# Altium project AudioMoth 1.1.0.PrjPcb
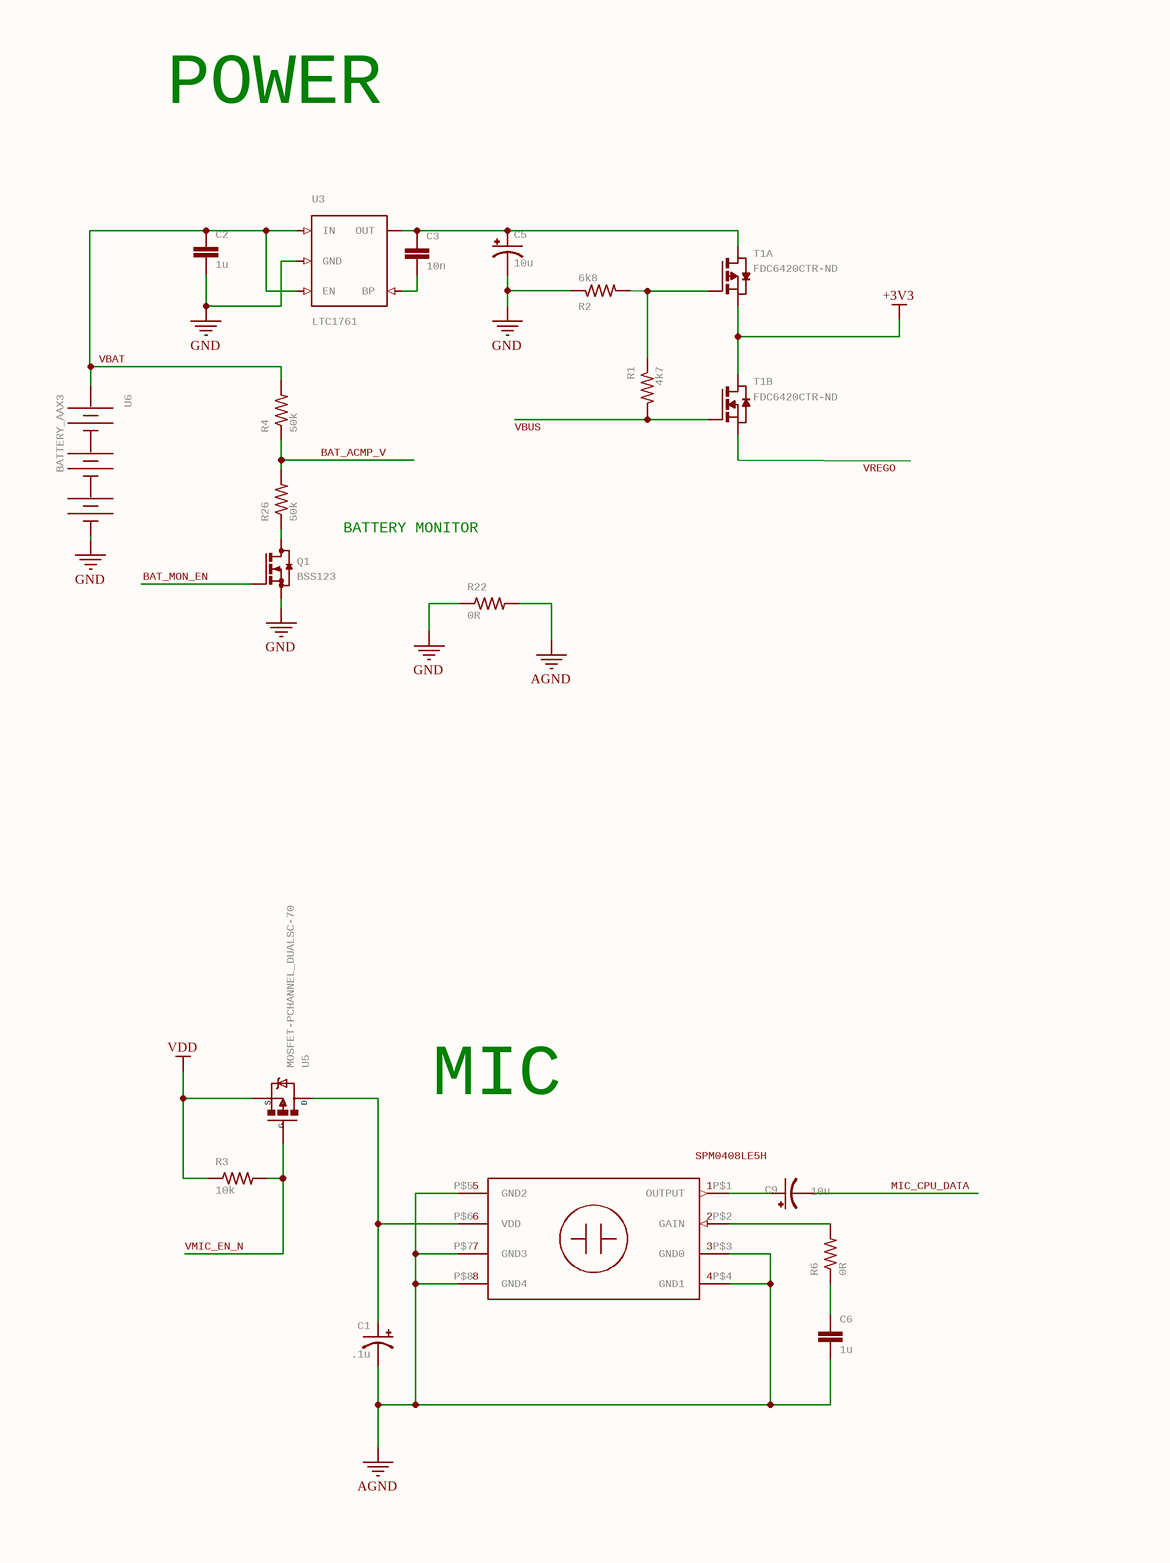
[diagram p0: AudioMoth 1.1.0.SchDoc, top left]
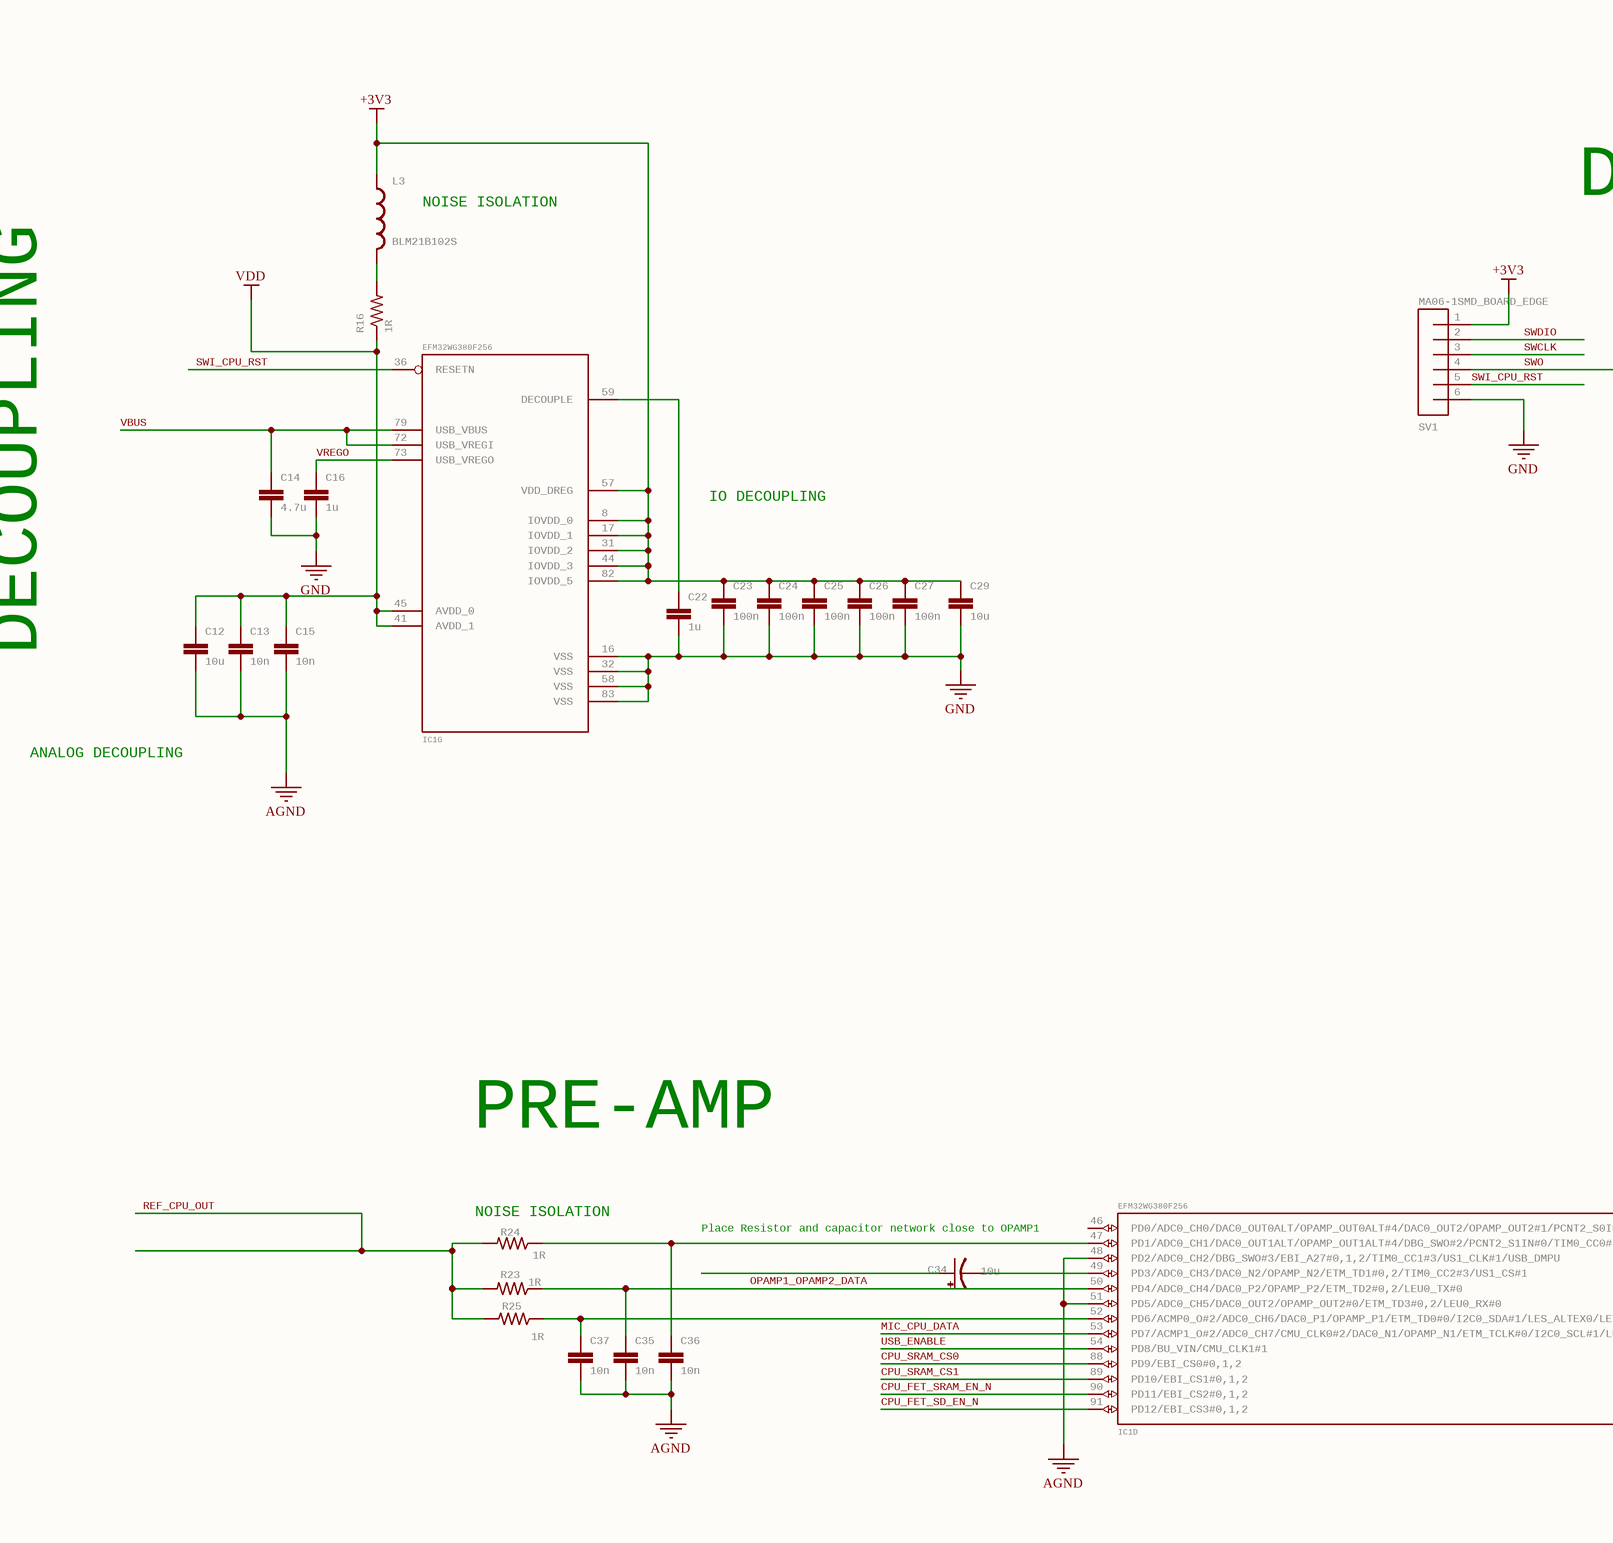
[diagram p1: AudioMoth 1.1.0.SchDoc, top middle]
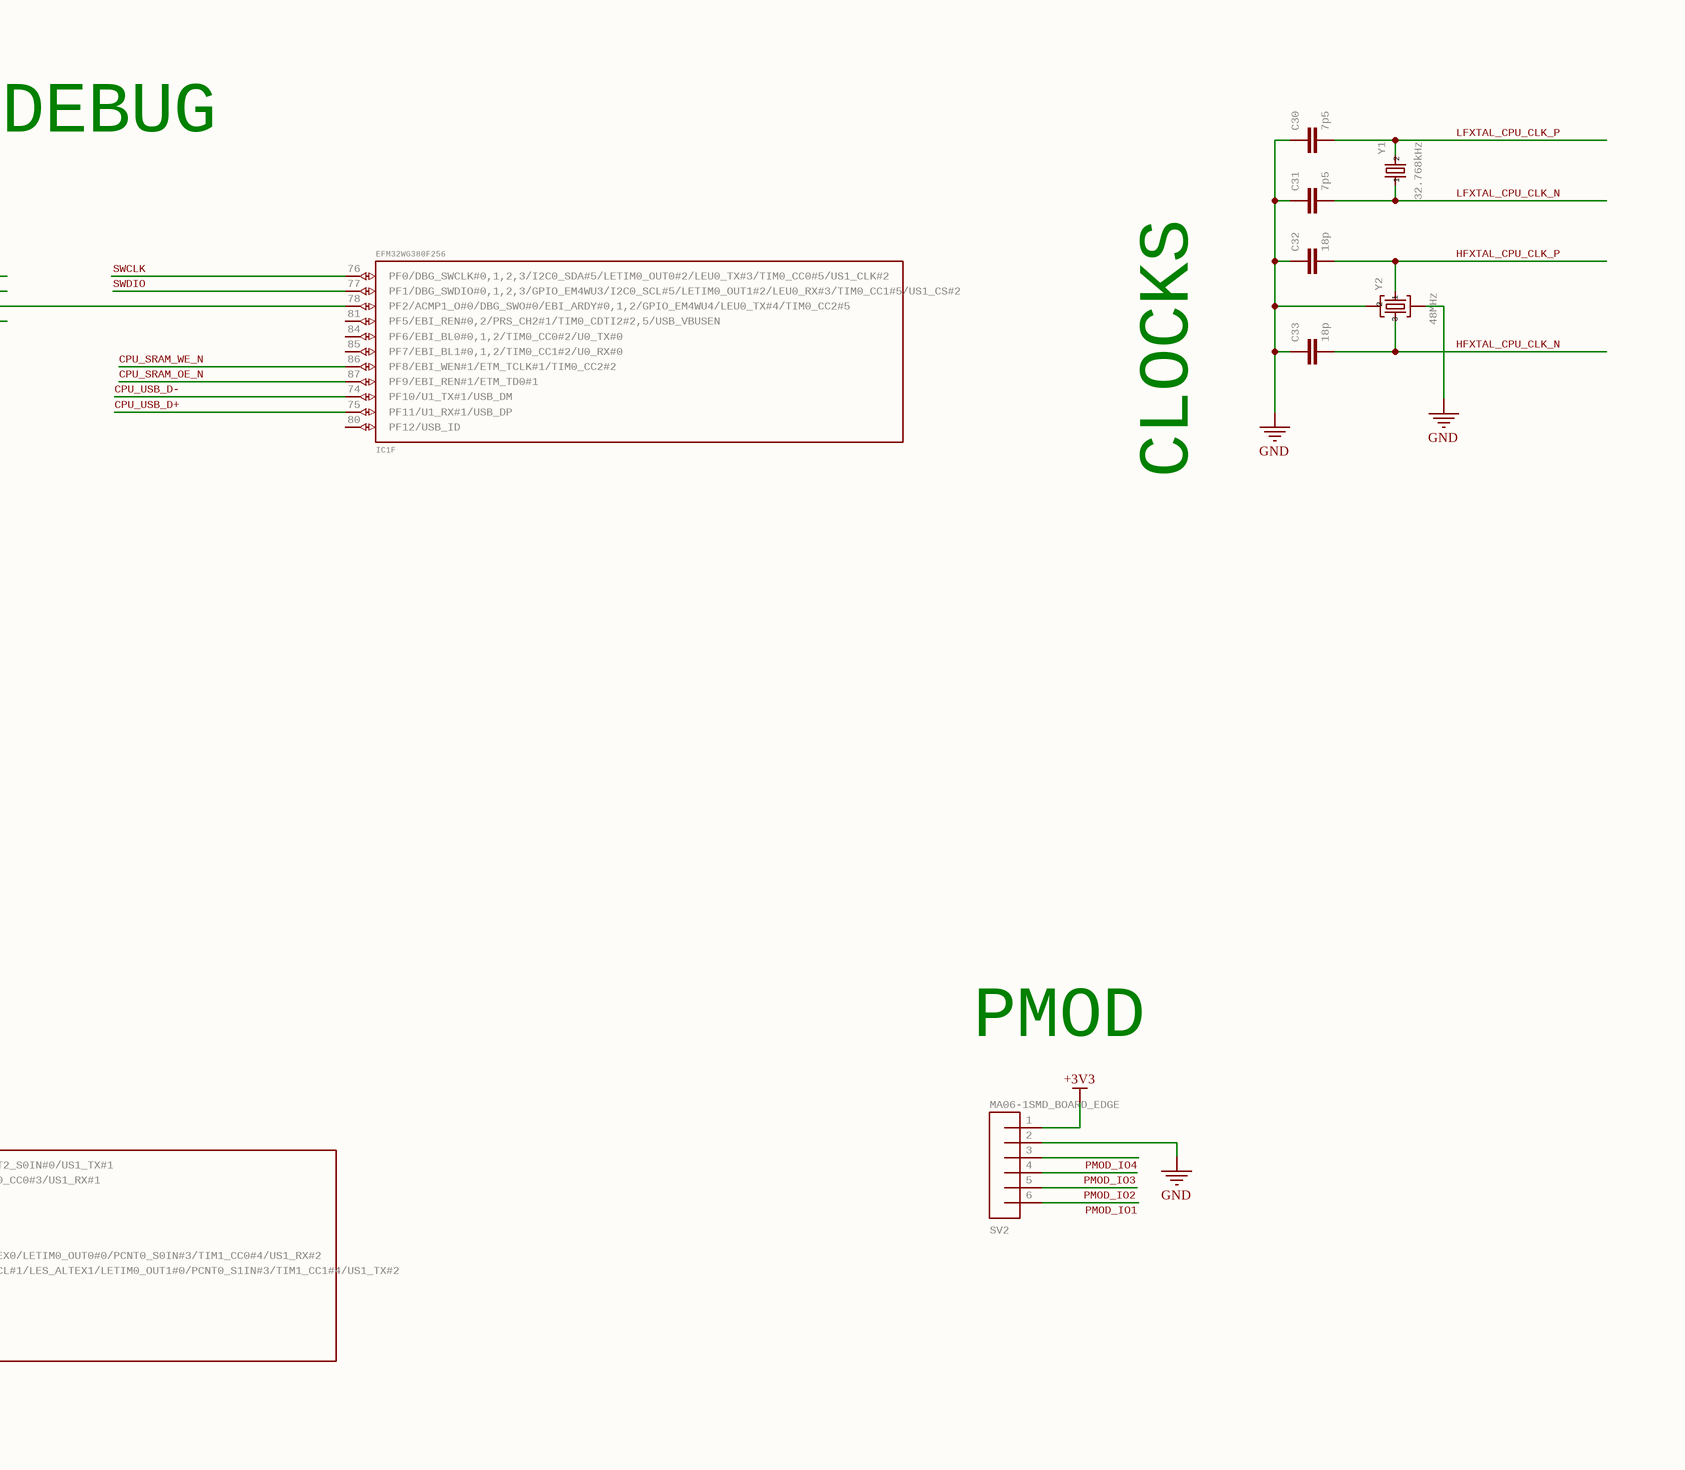
[diagram p2: AudioMoth 1.1.0.SchDoc, top right]
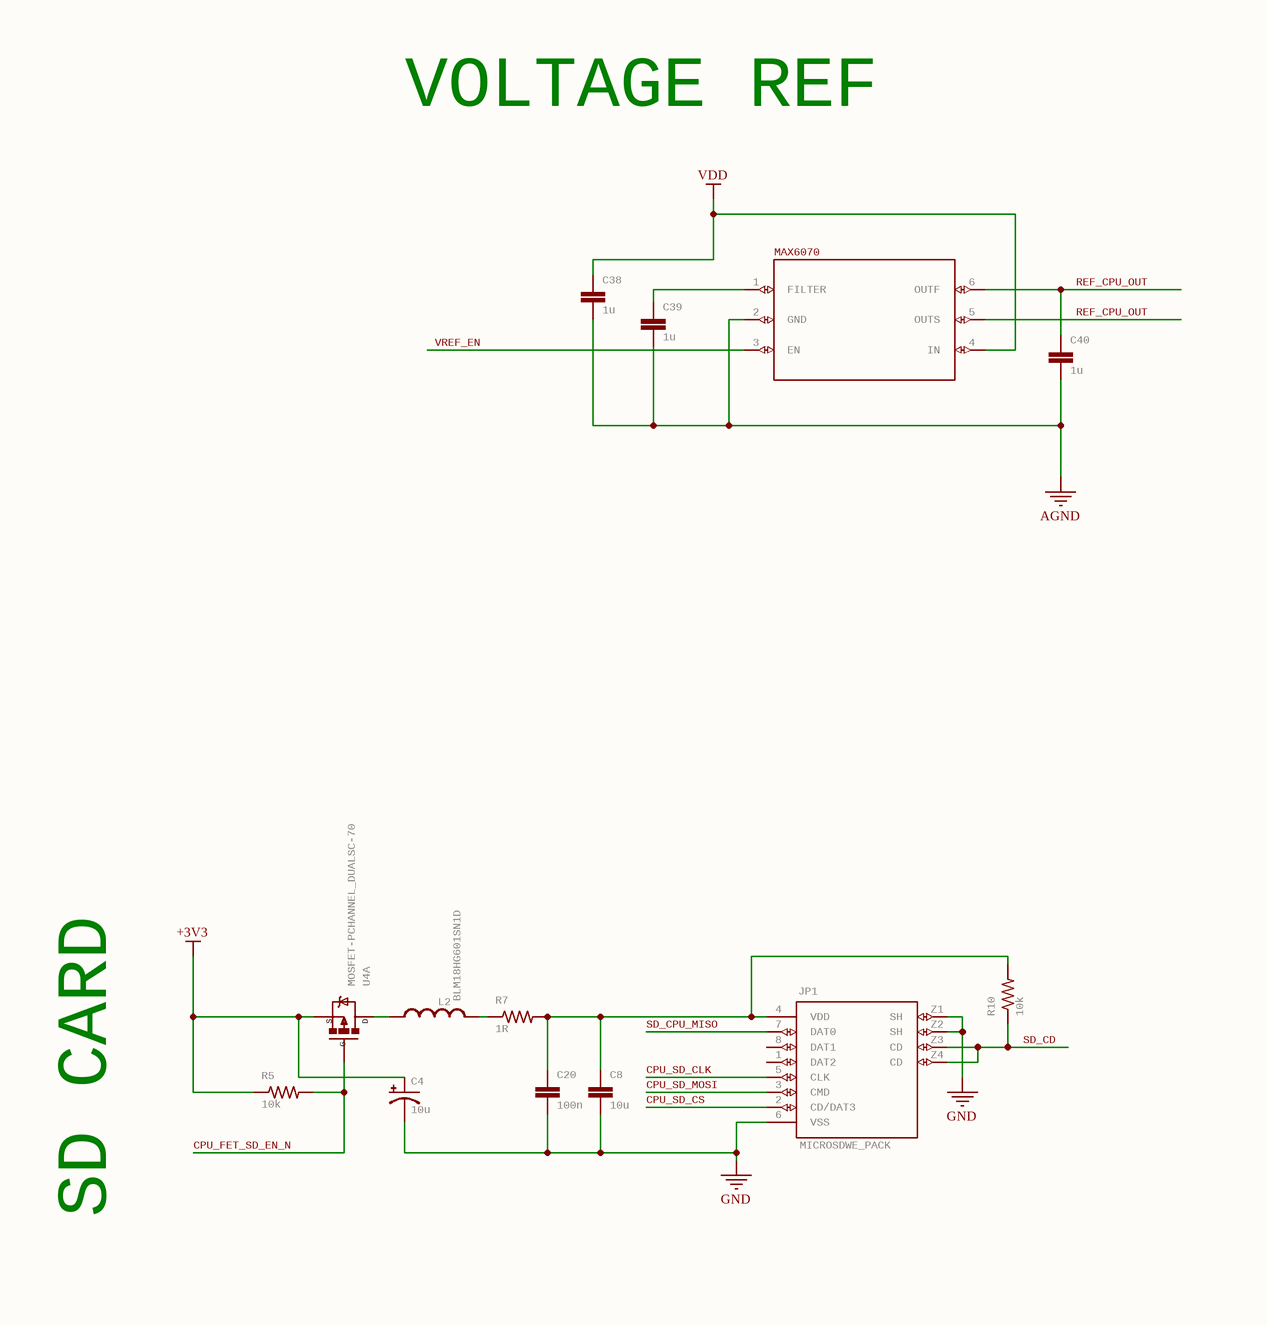
[diagram p3: AudioMoth 1.1.0.SchDoc, bottom left]
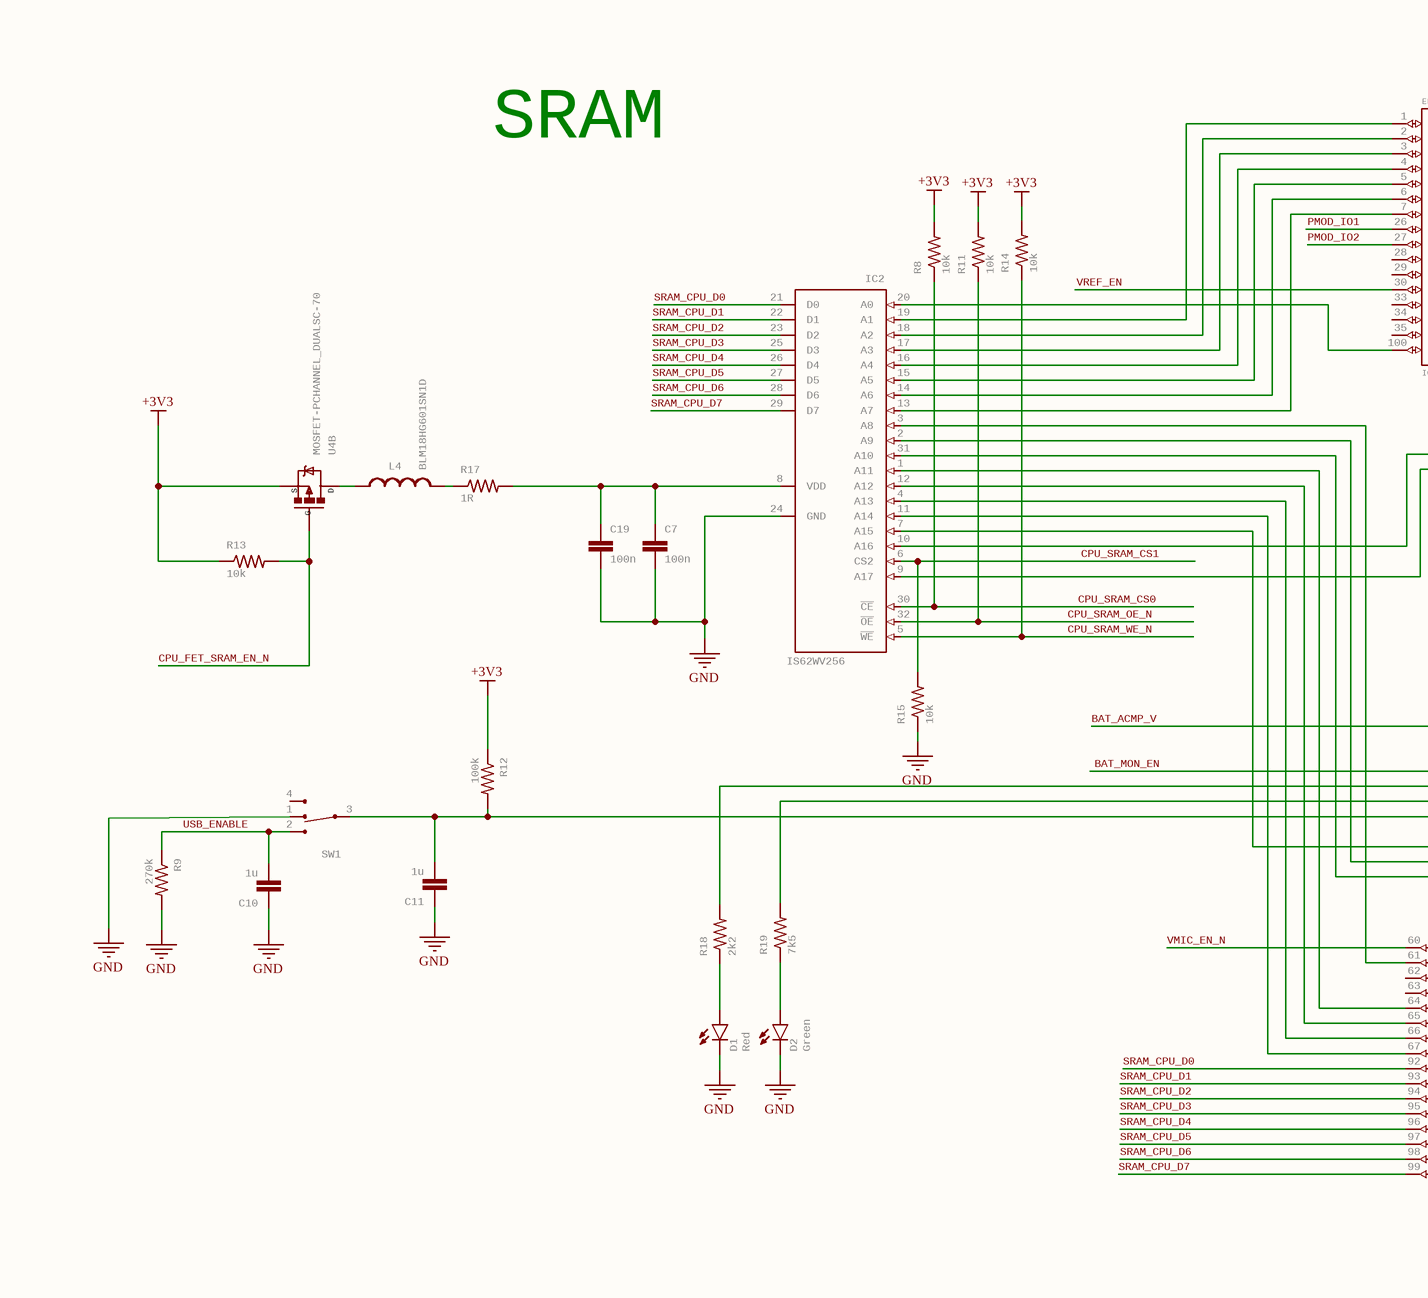
[diagram p4: AudioMoth 1.1.0.SchDoc, bottom middle]
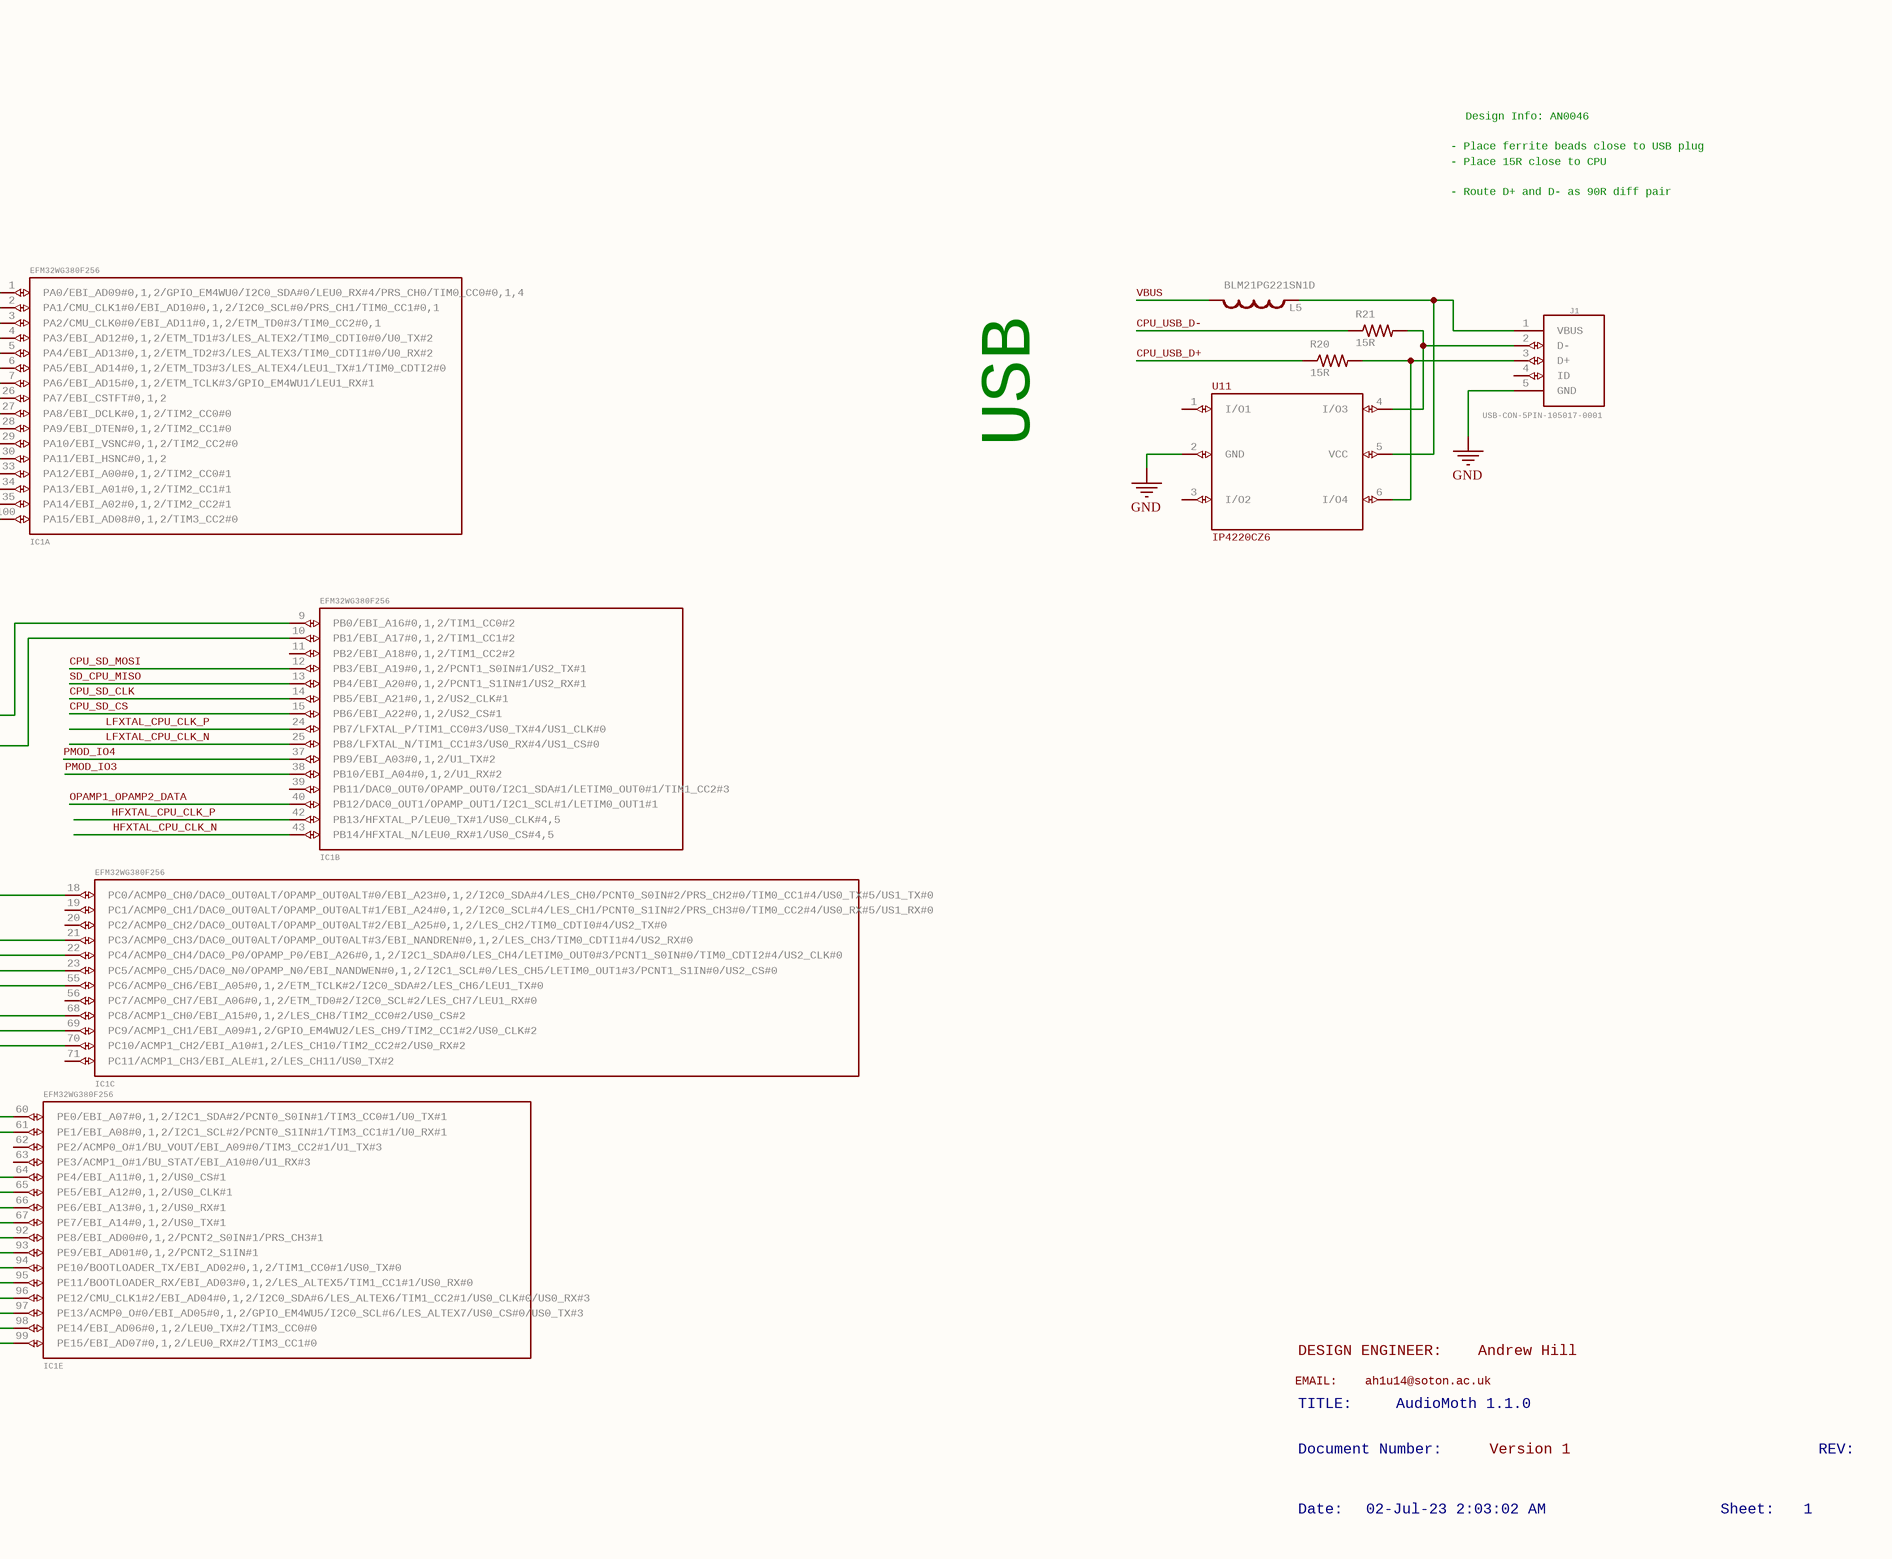
[diagram p5: AudioMoth 1.1.0.SchDoc, bottom right]
1 sheet, 86 parts. Net scope: global (net labels, ports and power ports of the same name join across sheets).
Board file: AudioMoth 1.1.0.PcbDoc

## Sheet AudioMoth 1.1.0.SchDoc: AudioMoth 1.1.0
size 885 x 577 mm; Origin: Eagle; Value: Verion 1; Date: 02-Jul-23 2:03:02 AM; SheetNumber: 1; GateName_1: G$1; SymbolName_1: FRAME_D_L; LibraryName: frames; DeviceSetName: FRAME_D_L; GateName_2: G$2; SymbolName_2: DOCFIELD; Sheet: Sheet:; REV: REV:

### Parts
C1  .1u  [EIA3216-KIT]
C2  1u  [0402]
C3  10n  [0402]
C4  10u  [EIA3216-KIT]
C5  10u  [EIA3216-KIT]
C6  1u  [0402]
C7  100n  [0402]
C8  10u  [C0603]
C9  10u  [EIA3216-KIT]
C10  1u  [0402]
C11  1u  [0402]
C12  10u  [0603-CAP]
C13  10n  [0402]
C14  4.7u  [0402]
C15  10n  [0402]
C16  1u  [0402]
C19  100n  [0402]
C20  100n  [0402]
C22  1u  [0402]
C23  100n  [0402]
C24  100n  [0402]
C25  100n  [0402]
C26  100n  [0402]
C27  100n  [0402]
C29  10u  [C0603]
C30  7p5  [0402]
C31  7p5  [0402]
C32  18p  [0402]
C33  18p  [0402]
C34  10u  [EIA3216-KIT]
C35  10n  [0402]
C36  10n  [0402]
C37  10n  [0402]
C38  1u  [0402]
C39  1u  [0402]
C40  1u  [0402]
D1  Red  [LED-0603]
D2  Green  [LED-0603]
IC1  EFM32WG380F256  [QFP100]  (parts A,B,C,D,E,F,G of 7)
IC2  IS62WV256  [IS62WV256]  (value not drawn)
J1  USB-CON-5PIN-105017-0001  [USB-MICRO-MOLEX-105017-0001]
JP1  MICROSDWE_PACK  [693071010811]
L2  BLM18HG601SN1D  [0603-RES]
L3  BLM21B102S  [0805]
L4  BLM18HG601SN1D  [0603-RES]
L5  BLM21PG221SN1D  [0603-RES]
Q1  BSS123  [SOT23]
R1  4k7  [0402]
R2  6k8  [0402]
R3  10k  [0402]
R4  50k  [0402]
R5  10k  [0402]
R6  0R  [0402]
R7  1R  [0402]
R8  10k  [0402]
R9  270k  [0402]
R10  10k  [0402]
R11  10k  [0402]
R12  100k  [0402]
R13  10k  [0402]
R14  10k  [0402]
R15  10k  [0402]
R16  1R  [0402]
R17  1R  [0402]
R18  2k2  [0402]
R19  7k5  [0402]
R20  15R  [0402]
R21  15R  [0402]
R22  0R  [0603-RES]
R23  1R  [0402]
R24  1R  [0402]
R25  1R  [0402]
R26  50k  [0402]
SV1  MA06-1SMD_BOARD_EDGE  [TSM-106-X-SH-BOARDEDGE]
SV2  MA06-1SMD_BOARD_EDGE  [TSM-106-X-SH-BOARDEDGE]
SW1  CT10-XXXX-CSS131  [CT10-XXXX-G4]  (value not drawn)
T1  FDC6420CTR-ND  [SOT23-6]  (parts A,B of 2)
U1  MAX6070SOT23  [SOT26@1]  (value not drawn)
U2  SPM0408LE5H  [SPM0408LE5H-TB]  (value not drawn)
U3  LTC1761  [SOT23-5]
U4  MOSFET-PCHANNEL_DUALSC-70  [SC-70]  (parts A,B of 2)
U5  MOSFET-PCHANNEL_DUALSC-70  [SC-70]
U6  BATTERY_AAX3  [BATTERY-AAX3]
U11  IP4220CZ6  [SC-74]
Y1  32.768kHz  [CRYSTAL-32KHZ-SMD_EPSON_MC146]
Y2  48MHz  [XRCGB48M000F4M00R0]

### Nets
+3V3: C4.A(+) C23.1 C24.1 C25.1 C26.1 C27.1 C29.1 IC1.8(IOVDD_0) IC1.17(IOVDD_1) IC1.31(IOVDD_2) IC1.44(IOVDD_3) IC1.57(VDD_DREG) IC1.82(IOVDD_5) L3.1 R5.1 R8.2 R11.2 R12.1 R13.1 R14.2 SV1.1 SV2.1 T1.2(S) T1.6(D) U4.1(S) U4.4(S)
AGND: C1.C(-) C6.2 C12.2 C13.2 C15.2 C35.2 C36.2 C37.2 C38.2 C39.2 C40.2 IC1.48(PD2/ADC0_CH2/DBG_SWO#3/EBI_A27#0,1,2/TIM0_CC1#3/US1_CLK#1/USB_DMPU) IC1.51(PD5/ADC0_CH5/DAC0_OUT2/OPAMP_OUT2#0/ETM_TD3#0,2/LEU0_RX#0) R22.2 U1.2(GND) U2.P$3(GND0) U2.P$4(GND1) U2.P$5(GND2) U2.P$7(GND3) U2.P$8(GND4)
GND: C2.2 C4.C(-) C5.C(-) C7.2 C8.2 C10.1 C11.1 C14.2 C16.2 C19.2 C20.2 C22.2 C23.2 C24.2 C25.2 C26.2 C27.2 C29.2 C30.1 C31.1 C32.1 C33.1 D1.C D2.C IC1.16(VSS) IC1.32(VSS) IC1.58(VSS) IC1.83(VSS) IC2.24(GND) J1.5(GND) JP1.6(VSS) JP1.Z1(SH) JP1.Z2(SH) Q1.2(S) R2.1 R9.2 R15.1 R22.1 SV1.6 SV2.2 SW1.1 U3.2(GND) U6.GND@2(-) U11.2(GND) Y2.P$2 Y2.P$4
VDD: C12.1 C13.1 C15.1 C38.1 IC1.41(AVDD_1) IC1.45(AVDD_0) R3.1 R16.1 U1.4(IN) U5.1(S)
BAT_ACMP_V: IC1.18(PC0/ACMP0_CH0/DAC0_OUT0ALT/OPAMP_OUT0ALT#0/EBI_A23#0,1,2/I2C0_SDA#4/LES_CH0/PCNT0_S0IN#2/PRS_CH2#0/TIM0_CC1#4/US0_TX#5/US1_TX#0) R4.1 R26.2
BAT_MON_EN: IC1.21(PC3/ACMP0_CH3/DAC0_OUT0ALT/OPAMP_OUT0ALT#3/EBI_NANDREN#0,1,2/LES_CH3/TIM0_CDTI1#4/US2_RX#0) Q1.1(G)
CPU_FET_SD_EN_N: IC1.91(PD12/EBI_CS3#0,1,2) R5.2 U4.2(G)
CPU_FET_SRAM_EN_N: IC1.90(PD11/EBI_CS2#0,1,2) R13.2 U4.5(G)
CPU_SD_CLK: IC1.14(PB5/EBI_A21#0,1,2/US2_CLK#1) JP1.5(CLK)
CPU_SD_CS: IC1.15(PB6/EBI_A22#0,1,2/US2_CS#1) JP1.2(CD/DAT3)
CPU_SD_MOSI: IC1.12(PB3/EBI_A19#0,1,2/PCNT1_S0IN#1/US2_TX#1) JP1.3(CMD)
CPU_SRAM_CS0: IC1.88(PD9/EBI_CS0#0,1,2) IC2.30(~{CE}) R8.1
CPU_SRAM_CS1: IC1.89(PD10/EBI_CS1#0,1,2) IC2.6(CS2) R15.2
CPU_SRAM_OE_N: IC1.87(PF9/EBI_REN#1/ETM_TD0#1) IC2.32(~{OE}) R11.1
CPU_SRAM_WE_N: IC1.86(PF8/EBI_WEN#1/ETM_TCLK#1/TIM0_CC2#2) IC2.5(~{WE}) R14.1
CPU_USB_D+: IC1.75(PF11/U1_RX#1/USB_DP) R20.1
CPU_USB_D-: IC1.74(PF10/U1_TX#1/USB_DM) R21.1
HFXTAL_CPU_CLK_N: C33.2 IC1.43(PB14/HFXTAL_N/LEU0_RX#1/US0_CS#4,5) Y2.P$3
HFXTAL_CPU_CLK_P: C32.2 IC1.42(PB13/HFXTAL_P/LEU0_TX#1/US0_CLK#4,5) Y2.P$1
LFXTAL_CPU_CLK_N: C31.2 IC1.25(PB8/LFXTAL_N/TIM1_CC1#3/US0_RX#4/US1_CS#0) Y1.P$2
LFXTAL_CPU_CLK_P: C30.2 IC1.24(PB7/LFXTAL_P/TIM1_CC0#3/US0_TX#4/US1_CLK#0) Y1.P$1
MIC_CPU_DATA: C9.C(-) IC1.53(PD7/ACMP1_O#2/ADC0_CH7/CMU_CLK0#2/DAC0_N1/OPAMP_N1/ETM_TCLK#0/I2C0_SCL#1/LES_ALTEX1/LETIM0_OUT1#0/PCNT0_S1IN#3/TIM1_CC1#4/US1_TX#2)
OPAMP1_OPAMP2_DATA: C34.A(+) IC1.40(PB12/DAC0_OUT1/OPAMP_OUT1/I2C1_SCL#1/LETIM0_OUT1#1)
PMOD_IO1: IC1.26(PA7/EBI_CSTFT#0,1,2) SV2.6
PMOD_IO2: IC1.27(PA8/EBI_DCLK#0,1,2/TIM2_CC0#0) SV2.5
PMOD_IO3: IC1.38(PB10/EBI_A04#0,1,2/U1_RX#2) SV2.4
PMOD_IO4: IC1.37(PB9/EBI_A03#0,1,2/U1_TX#2) SV2.3
REF_CPU_OUT: C40.1 R23.2 R24.2 R25.2 U1.5(OUTS) U1.6(OUTF)
SD_CD: JP1.Z3(CD) JP1.Z4(CD) R10.1
SD_CPU_MISO: IC1.13(PB4/EBI_A20#0,1,2/PCNT1_S1IN#1/US2_RX#1) JP1.7(DAT0)
SRAM_CPU_D0: IC1.92(PE8/EBI_AD00#0,1,2/PCNT2_S0IN#1/PRS_CH3#1) IC2.21(D0)
SRAM_CPU_D1: IC1.93(PE9/EBI_AD01#0,1,2/PCNT2_S1IN#1) IC2.22(D1)
SRAM_CPU_D2: IC1.94(PE10/BOOTLOADER_TX/EBI_AD02#0,1,2/TIM1_CC0#1/US0_TX#0) IC2.23(D2)
SRAM_CPU_D3: IC1.95(PE11/BOOTLOADER_RX/EBI_AD03#0,1,2/LES_ALTEX5/TIM1_CC1#1/US0_RX#0) IC2.25(D3)
SRAM_CPU_D4: IC1.96(PE12/CMU_CLK1#2/EBI_AD04#0,1,2/I2C0_SDA#6/LES_ALTEX6/TIM1_CC2#1/US0_CLK#0/US0_RX#3) IC2.26(D4)
SRAM_CPU_D5: IC1.97(PE13/ACMP0_O#0/EBI_AD05#0,1,2/GPIO_EM4WU5/I2C0_SCL#6/LES_ALTEX7/US0_CS#0/US0_TX#3) IC2.27(D5)
SRAM_CPU_D6: IC1.98(PE14/EBI_AD06#0,1,2/LEU0_TX#2/TIM3_CC0#0) IC2.28(D6)
SRAM_CPU_D7: IC1.99(PE15/EBI_AD07#0,1,2/LEU0_RX#2/TIM3_CC1#0) IC2.29(D7)
SWCLK: IC1.76(PF0/DBG_SWCLK#0,1,2,3/I2C0_SDA#5/LETIM0_OUT0#2/LEU0_TX#3/TIM0_CC0#5/US1_CLK#2) SV1.3
SWDIO: IC1.77(PF1/DBG_SWDIO#0,1,2,3/GPIO_EM4WU3/I2C0_SCL#5/LETIM0_OUT1#2/LEU0_RX#3/TIM0_CC1#5/US1_CS#2) SV1.2
SWI_CPU_RST: IC1.36(RESETN) SV1.5
SWO: IC1.78(PF2/ACMP1_O#0/DBG_SWO#0/EBI_ARDY#0,1,2/GPIO_EM4WU4/LEU0_TX#4/TIM0_CC2#5) SV1.4
USB_ENABLE: C10.2 IC1.54(PD8/BU_VIN/CMU_CLK1#1) R9.1 SW1.2
VBAT: C2.1 R4.2 U3.1(IN) U3.3(EN) U6.PWR@1(+)
VBUS: C14.1 IC1.72(USB_VREGI) IC1.79(USB_VBUS) L5.2 R1.2 T1.1(G)
VMIC_EN_N: IC1.60(PE0/EBI_A07#0,1,2/I2C1_SDA#2/PCNT0_S0IN#1/TIM3_CC0#1/U0_TX#1) R3.2 U5.2(G)
VREF_EN: IC1.30(PA11/EBI_HSNC#0,1,2) U1.3(EN)
VREGO: C16.1 IC1.73(USB_VREGO) T1.5(S)
NetC1_A: C1.A(+) U2.P$6(VDD) U5.6(D)
NetC3_1: C3.1 C5.A(+) T1.4(D) U3.5(OUT)
NetC3_2: C3.2 U3.4(BP)
NetC6_1: C6.1 R6.1
NetC7_1: C7.1 C19.1 IC2.8(VDD) R17.2
NetC8_1: C8.1 C20.1 JP1.4(VDD) R7.2 R10.2
NetC9_A: C9.A(+) U2.P$1(OUTPUT)
NetC11_2: C11.2 IC1.55(PC6/ACMP0_CH6/EBI_A05#0,1,2/ETM_TCLK#2/I2C0_SDA#2/LES_CH6/LEU1_TX#0) R12.2 SW1.3
NetC22_1: C22.1 IC1.59(DECOUPLE)
NetC34_C: C34.C(-) IC1.49(PD3/ADC0_CH3/DAC0_N2/OPAMP_N2/ETM_TD1#0,2/TIM0_CC2#3/US1_CS#1)
NetC35_1: C35.1 IC1.50(PD4/ADC0_CH4/DAC0_P2/OPAMP_P2/ETM_TD2#0,2/LEU0_TX#0) R23.1
NetC36_1: C36.1 IC1.47(PD1/ADC0_CH1/DAC0_OUT1ALT/OPAMP_OUT1ALT#4/DBG_SWO#2/PCNT2_S1IN#0/TIM0_CC0#3/US1_RX#1) R24.1
NetC37_1: C37.1 IC1.52(PD6/ACMP0_O#2/ADC0_CH6/DAC0_P1/OPAMP_P1/ETM_TD0#0/I2C0_SDA#1/LES_ALTEX0/LETIM0_OUT0#0/PCNT0_S0IN#3/TIM1_CC0#4/US1_RX#2) R25.1
NetC39_1: C39.1 U1.1(FILTER)
NetD1_A: D1.A R18.1
NetD2_A: D2.A R19.1
NetIC1_1: IC1.1(PA0/EBI_AD09#0,1,2/GPIO_EM4WU0/I2C0_SDA#0/LEU0_RX#4/PRS_CH0/TIM0_CC0#0,1,4) IC2.19(A1)
NetIC1_2: IC1.2(PA1/CMU_CLK1#0/EBI_AD10#0,1,2/I2C0_SCL#0/PRS_CH1/TIM0_CC1#0,1) IC2.18(A2)
NetIC1_3: IC1.3(PA2/CMU_CLK0#0/EBI_AD11#0,1,2/ETM_TD0#3/TIM0_CC2#0,1) IC2.17(A3)
NetIC1_4: IC1.4(PA3/EBI_AD12#0,1,2/ETM_TD1#3/LES_ALTEX2/TIM0_CDTI0#0/U0_TX#2) IC2.16(A4)
NetIC1_5: IC1.5(PA4/EBI_AD13#0,1,2/ETM_TD2#3/LES_ALTEX3/TIM0_CDTI1#0/U0_RX#2) IC2.15(A5)
NetIC1_6: IC1.6(PA5/EBI_AD14#0,1,2/ETM_TD3#3/LES_ALTEX4/LEU1_TX#1/TIM0_CDTI2#0) IC2.14(A6)
NetIC1_7: IC1.7(PA6/EBI_AD15#0,1,2/ETM_TCLK#3/GPIO_EM4WU1/LEU1_RX#1) IC2.13(A7)
NetIC1_9: IC1.9(PB0/EBI_A16#0,1,2/TIM1_CC0#2) IC2.10(A16)
NetIC1_10: IC1.10(PB1/EBI_A17#0,1,2/TIM1_CC1#2) IC2.9(A17)
NetIC1_22: IC1.22(PC4/ACMP0_CH4/DAC0_P0/OPAMP_P0/EBI_A26#0,1,2/I2C1_SDA#0/LES_CH4/LETIM0_OUT0#3/PCNT1_S0IN#0/TIM0_CDTI2#4/US2_CLK#0) R18.2
NetIC1_23: IC1.23(PC5/ACMP0_CH5/DAC0_N0/OPAMP_N0/EBI_NANDWEN#0,1,2/I2C1_SCL#0/LES_CH5/LETIM0_OUT1#3/PCNT1_S1IN#0/US2_CS#0) R19.2
NetIC1_61: IC1.61(PE1/EBI_A08#0,1,2/I2C1_SCL#2/PCNT0_S1IN#1/TIM3_CC1#1/U0_RX#1) IC2.3(A8)
NetIC1_64: IC1.64(PE4/EBI_A11#0,1,2/US0_CS#1) IC2.1(A11)
NetIC1_65: IC1.65(PE5/EBI_A12#0,1,2/US0_CLK#1) IC2.12(A12)
NetIC1_66: IC1.66(PE6/EBI_A13#0,1,2/US0_RX#1) IC2.4(A13)
NetIC1_67: IC1.67(PE7/EBI_A14#0,1,2/US0_TX#1) IC2.11(A14)
NetIC1_68: IC1.68(PC8/ACMP1_CH0/EBI_A15#0,1,2/LES_CH8/TIM2_CC0#2/US0_CS#2) IC2.7(A15)
NetIC1_69: IC1.69(PC9/ACMP1_CH1/EBI_A09#1,2/GPIO_EM4WU2/LES_CH9/TIM2_CC1#2/US0_CLK#2) IC2.2(A9)
NetIC1_70: IC1.70(PC10/ACMP1_CH2/EBI_A10#1,2/LES_CH10/TIM2_CC2#2/US0_RX#2) IC2.31(A10)
NetIC1_100: IC1.100(PA15/EBI_AD08#0,1,2/TIM3_CC2#0) IC2.20(A0)
NetJ1_1: J1.1(VBUS) L5.1 U11.5(VCC)
NetJ1_2: J1.2(D-) R21.2 U11.4(I/O3)
NetJ1_3: J1.3(D+) R20.2 U11.6(I/O4)
NetL2_1: L2.1 U4.6(D)
NetL2_2: L2.2 R7.1
NetL3_2: L3.2 R16.2
NetL4_1: L4.1 U4.3(D)
NetL4_2: L4.2 R17.1
NetQ1_3: Q1.3(D) R26.1
NetR1_1: R1.1 R2.2 T1.3(G)
NetR6_2: R6.2 U2.P$2(GAIN)

Not connected (* = marked no-connect by the designer): IC1 11(PB2/EBI_A18#0,1,2/TIM1_CC2#2) 19(PC1/ACMP0_CH1/DAC0_OUT0ALT/OPAMP_OUT0ALT#1/EBI_A24#0,1,2/I2C0_SCL#4/LES_CH1/PCNT0_S1IN#2/PRS_CH3#0/TIM0_CC2#4/US0_RX#5/US1_RX#0) 20(PC2/ACMP0_CH2/DAC0_OUT0ALT/OPAMP_OUT0ALT#2/EBI_A25#0,1,2/LES_CH2/TIM0_CDTI0#4/US2_TX#0) 28(PA9/EBI_DTEN#0,1,2/TIM2_CC1#0) 29(PA10/EBI_VSNC#0,1,2/TIM2_CC2#0) 33(PA12/EBI_A00#0,1,2/TIM2_CC0#1) 34(PA13/EBI_A01#0,1,2/TIM2_CC1#1) 35(PA14/EBI_A02#0,1,2/TIM2_CC2#1) 39(PB11/DAC0_OUT0/OPAMP_OUT0/I2C1_SDA#1/LETIM0_OUT0#1/TIM1_CC2#3) 46(PD0/ADC0_CH0/DAC0_OUT0ALT/OPAMP_OUT0ALT#4/DAC0_OUT2/OPAMP_OUT2#1/PCNT2_S0IN#0/US1_TX#1) 56(PC7/ACMP0_CH7/EBI_A06#0,1,2/ETM_TD0#2/I2C0_SCL#2/LES_CH7/LEU1_RX#0) 62(PE2/ACMP0_O#1/BU_VOUT/EBI_A09#0/TIM3_CC2#1/U1_TX#3) 63(PE3/ACMP1_O#1/BU_STAT/EBI_A10#0/U1_RX#3) 71(PC11/ACMP1_CH3/EBI_ALE#1,2/LES_CH11/US0_TX#2) 80(PF12/USB_ID) 81(PF5/EBI_REN#0,2/PRS_CH2#1/TIM0_CDTI2#2,5/USB_VBUSEN) 84(PF6/EBI_BL0#0,1,2/TIM0_CC0#2/U0_TX#0) 85(PF7/EBI_BL1#0,1,2/TIM0_CC1#2/U0_RX#0); J1 4(ID); JP1 1(DAT2) 8(DAT1); SW1 4; U11 1(I/O1) 3(I/O2)

### Notes on the sheet
- POWER
- (near L3) NOISE ISOLATION
- DEBUG
- BATTERY MONITOR
- IO DECOUPLING
- CLOCKS
- DECOUPLING
- ANALOG DECOUPLING
- MIC
- (near U2) SPM0408LE5H
- PMOD
- PRE-AMP
- (near R24) NOISE ISOLATION
- (near C34) Place Resistor and capacitor network close to OPAMP1
- - Place ferrite beads close to USB plug
- - Place 15R close to CPU
- Design Info: AN0046
- VOLTAGE REF
- - Route D+ and D- as 90R diff pair
- SRAM
- USB
- (near IC2) IS62WV256
- SD CARD
- EMAIL:    ah1u14@soton.ac.uk
- DESIGN ENGINEER:    Andrew Hill
- TITLE:
- Document Number:
- AudioMoth 1.1.0
- Version 1
- REV:
- Date:
- 02-Jul-23 2:03:02 AM
- Sheet:
- 1

### Library data of the parts
C1 C4 C5 = CAP_POL1206-KIT: Capacitor PolarizedThese are standard SMD and PTH capacitors. Normally 10uF, 47uF, and 100uF in electrolytic and tantalum varieties. Always verify the external diameter of the through hole cap, it varies with capacity, voltage, and manufacturer. The EIA devices should be standard.; GateName_1: G$1; SymbolName_1: CAP_POL; DeviceName: 1206-KIT; LibraryName: SparkFun-Passives; DeviceSetName: CAP_POL; MF: MF; MPN: MPN; OC_FARNELL: OC_FARNELL
C2 C3 C6 C7 C10 C11 C13-C16 C19 C20 C22-C27 C30-C33 C35-C40 = CAP_0402: 0402 (1005 Metric) Nick Garner - TeleSense; GateName_1: G$1; SymbolName_1: CAP; LibraryName: Perfect_0402; DeviceSetName: CAP_0402
  C35-C40: MF: MF; MPN: MPN; OC_FARNELL: OC_FARNELL
C8 C29 = C-EUC0603: CAPACITOR, European symbol; GateName_1: G$1; SymbolName_1: C-EU; DeviceName: C0603; LibraryName: rcl; DeviceSetName: C-EU; MF: MF; MPN: MPN; OC_FARNELL: OC_FARNELL
C9 C34 = CAP_POL1206-KIT: Capacitor PolarizedThese are standard SMD and PTH capacitors. Normally 10uF, 47uF, and 100uF in electrolytic and tantalum varieties. Always verify the external diameter of the through hole cap, it varies with capacity, voltage, and manufacturer. The EIA devices should be standard.; MPN: 0603ZD106MAT2A; GateName_1: G$1; MF: AVX; SymbolName_1: CAP_POL; DeviceName: 1206-KIT; LibraryName: SparkFun-Passives; DeviceSetName: CAP_POL; OC_FARNELL: 1867954
C12 = CAP0603-CAP: CapacitorStandard 0603 ceramic capacitor, and 0.1" leaded capacitor.; GateName_1: G$1; SymbolName_1: CAP; DeviceName: 0603-CAP; LibraryName: SparkFun-Capacitors; DeviceSetName: CAP; MF: MF; MPN: MPN; OC_FARNELL: OC_FARNELL
D1 D2 = LED0603: LEDsStandard schematic elements and footprints for 5mm, 3mm, 1206, and 0603 sized LEDs. 5mm - Spark Fun Electronics SKU : COM-00529 (and others); GateName_1: G$1; SymbolName_1: LED; DeviceName: 0603; LibraryName: SparkFun-LED; DeviceSetName: LED
IC1 = EFM32WG380F256: EFM32WG380F256 Wonder Microcontroller in 14mm x 14mm QFP100 package; GateName_1: A; SymbolName_1: EFM32WG380F256_A; GateName_2: B; SymbolName_2: EFM32WG380F256_B; GateName_3: C; SymbolName_3: EFM32WG380F256_C; GateName_4: D; SymbolName_4: EFM32WG380F256_D; GateName_5: E; SymbolName_5: EFM32WG380F256_E; GateName_6: F; SymbolName_6: EFM32WG380F256_F; GateName_7: PWR; SymbolName_7: EFM32WG380F256_PWR; LibraryName: EFM32; DeviceSetName: EFM32WG380F256
IC2 = IS62WV256: GateName_1: G$1; SymbolName_1: IS62WV256; LibraryName: acousticLib; DeviceSetName: IS62WV256
J1 = USB-CON-5PIN-105017-0001: Molex Micro USB 105017-0001; GateName_1: G$1; SymbolName_1: USB-5PIN; DeviceName: -105017-0001; LibraryName: GeekAmmo; DeviceSetName: USB-CON-5PIN
JP1 = MICROSDWE_PACK: GateName_1: G$1; SymbolName_1: MICROSD; DeviceName: WE_PACK; LibraryName: acousticLib; DeviceSetName: MICROSD; MF: MF; MPN: MPN; OC_FARNELL: OC_FARNELL
L2 L4 L5 = INDUCTOR0603: Inductors   Basic Inductor/Choke - 0603 and 1206. Footprints are not proven and vary greatly between part numbers. SRN6045- 33uH, 20% 1.4A SDR0403-560KL - 56uH, 10%, 500mA RMS/740mA peak; GateName_1: G$1; DeviceName: 0603; SymbolName_1: INDUCTOR; LibraryName: acousticLib; DeviceSetName: INDUCTOR; MF: MF; MPN: MPN; OC_FARNELL: unknown
L3 = INDUCTOR0805: Inductors   Basic Inductor/Choke - 0603 and 1206. Footprints are not proven and vary greatly between part numbers. INDUCTOR POWER 3.3UH 4.0A SMD 0.197" L x 0.197" W x 0.177" H (5.00mm x 5.00mm x 4.50mm); GateName_1: G$1; SymbolName_1: INDUCTOR; DeviceName: 0805; LibraryName: SparkFun-Passives; DeviceSetName: INDUCTOR
Q1 = BSS123: N-CHANNEL MOS FET; GateName_1: G$1; SymbolName_1: N-MOS; LibraryName: transistor-small-signal; DeviceSetName: BSS123
R1-R21 R26 = RES_0402: 0402 (1005 Metric) Nick Garner - TeleSense; GateName_1: G$1; SymbolName_1: RESISTOR; LibraryName: Perfect_0402; DeviceSetName: RES_0402
R22 = RESISTOR0603-RES: ResistorBasic schematic elements and footprints for 0603, 1206, and PTH resistors.; GateName_1: G$1; SymbolName_1: RESISTOR; DeviceName: 0603-RES; LibraryName: SparkFun-Passives; DeviceSetName: RESISTOR
R23-R25 = RES_0402: 0402 (1005 Metric) Nick Garner - TeleSense; MPN: MC0063W0603510K; GateName_1: G$1; SymbolName_1: RESISTOR; MF: MULTICOMP; LibraryName: Perfect_0402; DeviceSetName: RES_0402; OC_FARNELL: 9331700
SV1 SV2 = MA06-1SMD_BOARD_EDGE: PIN HEADER; GateName_1: 1; SymbolName_1: MA06-1; DeviceName: SMD_BOARD_EDGE; LibraryName: acousticLib; DeviceSetName: MA06-1; MF: MF; MPN: MPN; OC_FARNELL: OC_FARNELL
SW1 = CT10-XXXX-CSS131: CT10 Series Molded Switch   Source: www.cotorelay.com .. Coto_Technology__CT10-1530-G1.pdf; GateName_1: G$1; SymbolName_1: SWITCH-NO; DeviceName: CSS131; LibraryName: switch-coto; DeviceSetName: CT10-XXXX-
T1 = PN_MOSFET-: DUAL N AND P-CHANNEL ENHANCEMENT MODE MOSFET   Source: Data sheet; GateName_1: 2; SymbolName_1: P_MOSFET; GateName_2: 1; SymbolName_2: N_MOSFET; LibraryName: zetex; DeviceSetName: PN_MOSFET-
U1 = MAX6070SOT23: GateName_1: G$1; DeviceName: SOT23; SymbolName_1: MAX6070; LibraryName: acousticLib; DeviceSetName: MAX6070; MAX6070: MAX6070
U2 = SPM0408LE5H: GateName_1: G$1; SymbolName_1: SPM0408LE5H; LibraryName: acousticLib; DeviceSetName: SPM0408LE5H; 1: 1; 2: 2; 3: 3; 4: 4; 5: 5; 6: 6; 7: 7; 8: 8
U3 = LTC1761: GateName_1: U$1; SymbolName_1: V-REG-LDO; LibraryName: acousticLib; DeviceSetName: LTC1761; MF: MF; MPN: MPN; OC_FARNELL: OC_FARNELL
U4 = MOSFET-PCHANNEL_DUALSC-70: GateName_1: G1; GateName_2: G2; SymbolName_1: MOSFET-PCHANNEL; SymbolName_2: MOSFET-PCHANNEL; DeviceName: SC-70; LibraryName: acousticLib; DeviceSetName: MOSFET-PCHANNEL_DUAL; D: D; S: S; G: G
U5 = MOSFET-PCHANNEL_DUALSC-70: GateName_1: G1; SymbolName_1: MOSFET-PCHANNEL; DeviceName: SC-70; LibraryName: acousticLib; DeviceSetName: MOSFET-PCHANNEL_DUAL; D: D; S: S; G: G
U6 = BATTERY_AAX3: GateName_1: G$1; SymbolName_1: BATTX3; LibraryName: acousticLib; DeviceSetName: BATTERY_AAX3
U11 = IP4220CZ6: IP4220CZ6     The IP4220CZ6 is designed to protect I/O lines sensitive to capacitive load, such as USB 2.0 http://www.farnell.com/datasheets/1708221.pdf; GateName_1: G$1; SymbolName_1: IP4220CZ6; LibraryName: acousticLib; DeviceSetName: IP4220CZ6; IP4220CZ6: IP4220CZ6
Y1 = CRYSTALEPSONMC146: Various standard crystals. Proven footprints.; MPN: X32K768S019; GateName_1: G$1; SymbolName_1: Q; MF: AEL CRYSTALS; DeviceName: EPSONMC146; LibraryName: acousticLib; DeviceSetName: CRYSTAL; 1: 1; 2: 2; OC_FARNELL: 2467443
Y2 = XRCGB48M000F4M00R0: XRCGB48M000F4M00R0     48MHz Clock; MPN: ABM3B-12.000MHZ-B2-T; GateName_1: G$1; SymbolName_1: CRYSTAL-FILTER-3-POL; MF: ABRACON; LibraryName: acousticLib; DeviceSetName: XRCGB48M000F4M00R0; 1: 1; 2: 2; 3: 3; OC_FARNELL: 1611810